# EasyEDA Pro project ProPrj_轮腿机器人-世博同学-正式版.epro, schematic 双轮腿-第一次量产版本
Board Name: 主板-ESP32; Create Date: 2024-08-16; Page Name: v3.0; Project Name: 轮腿机器人-世博同学-正式版; Schematic Name: 双轮腿-第一次量产版本; Update Date: 2024-11-18; Add into BOM: yes; Convert to PCB: yes; Date: 2022-08-08; Draw By: MUSHIBO; REV: 1.0; Sheet: 1/1
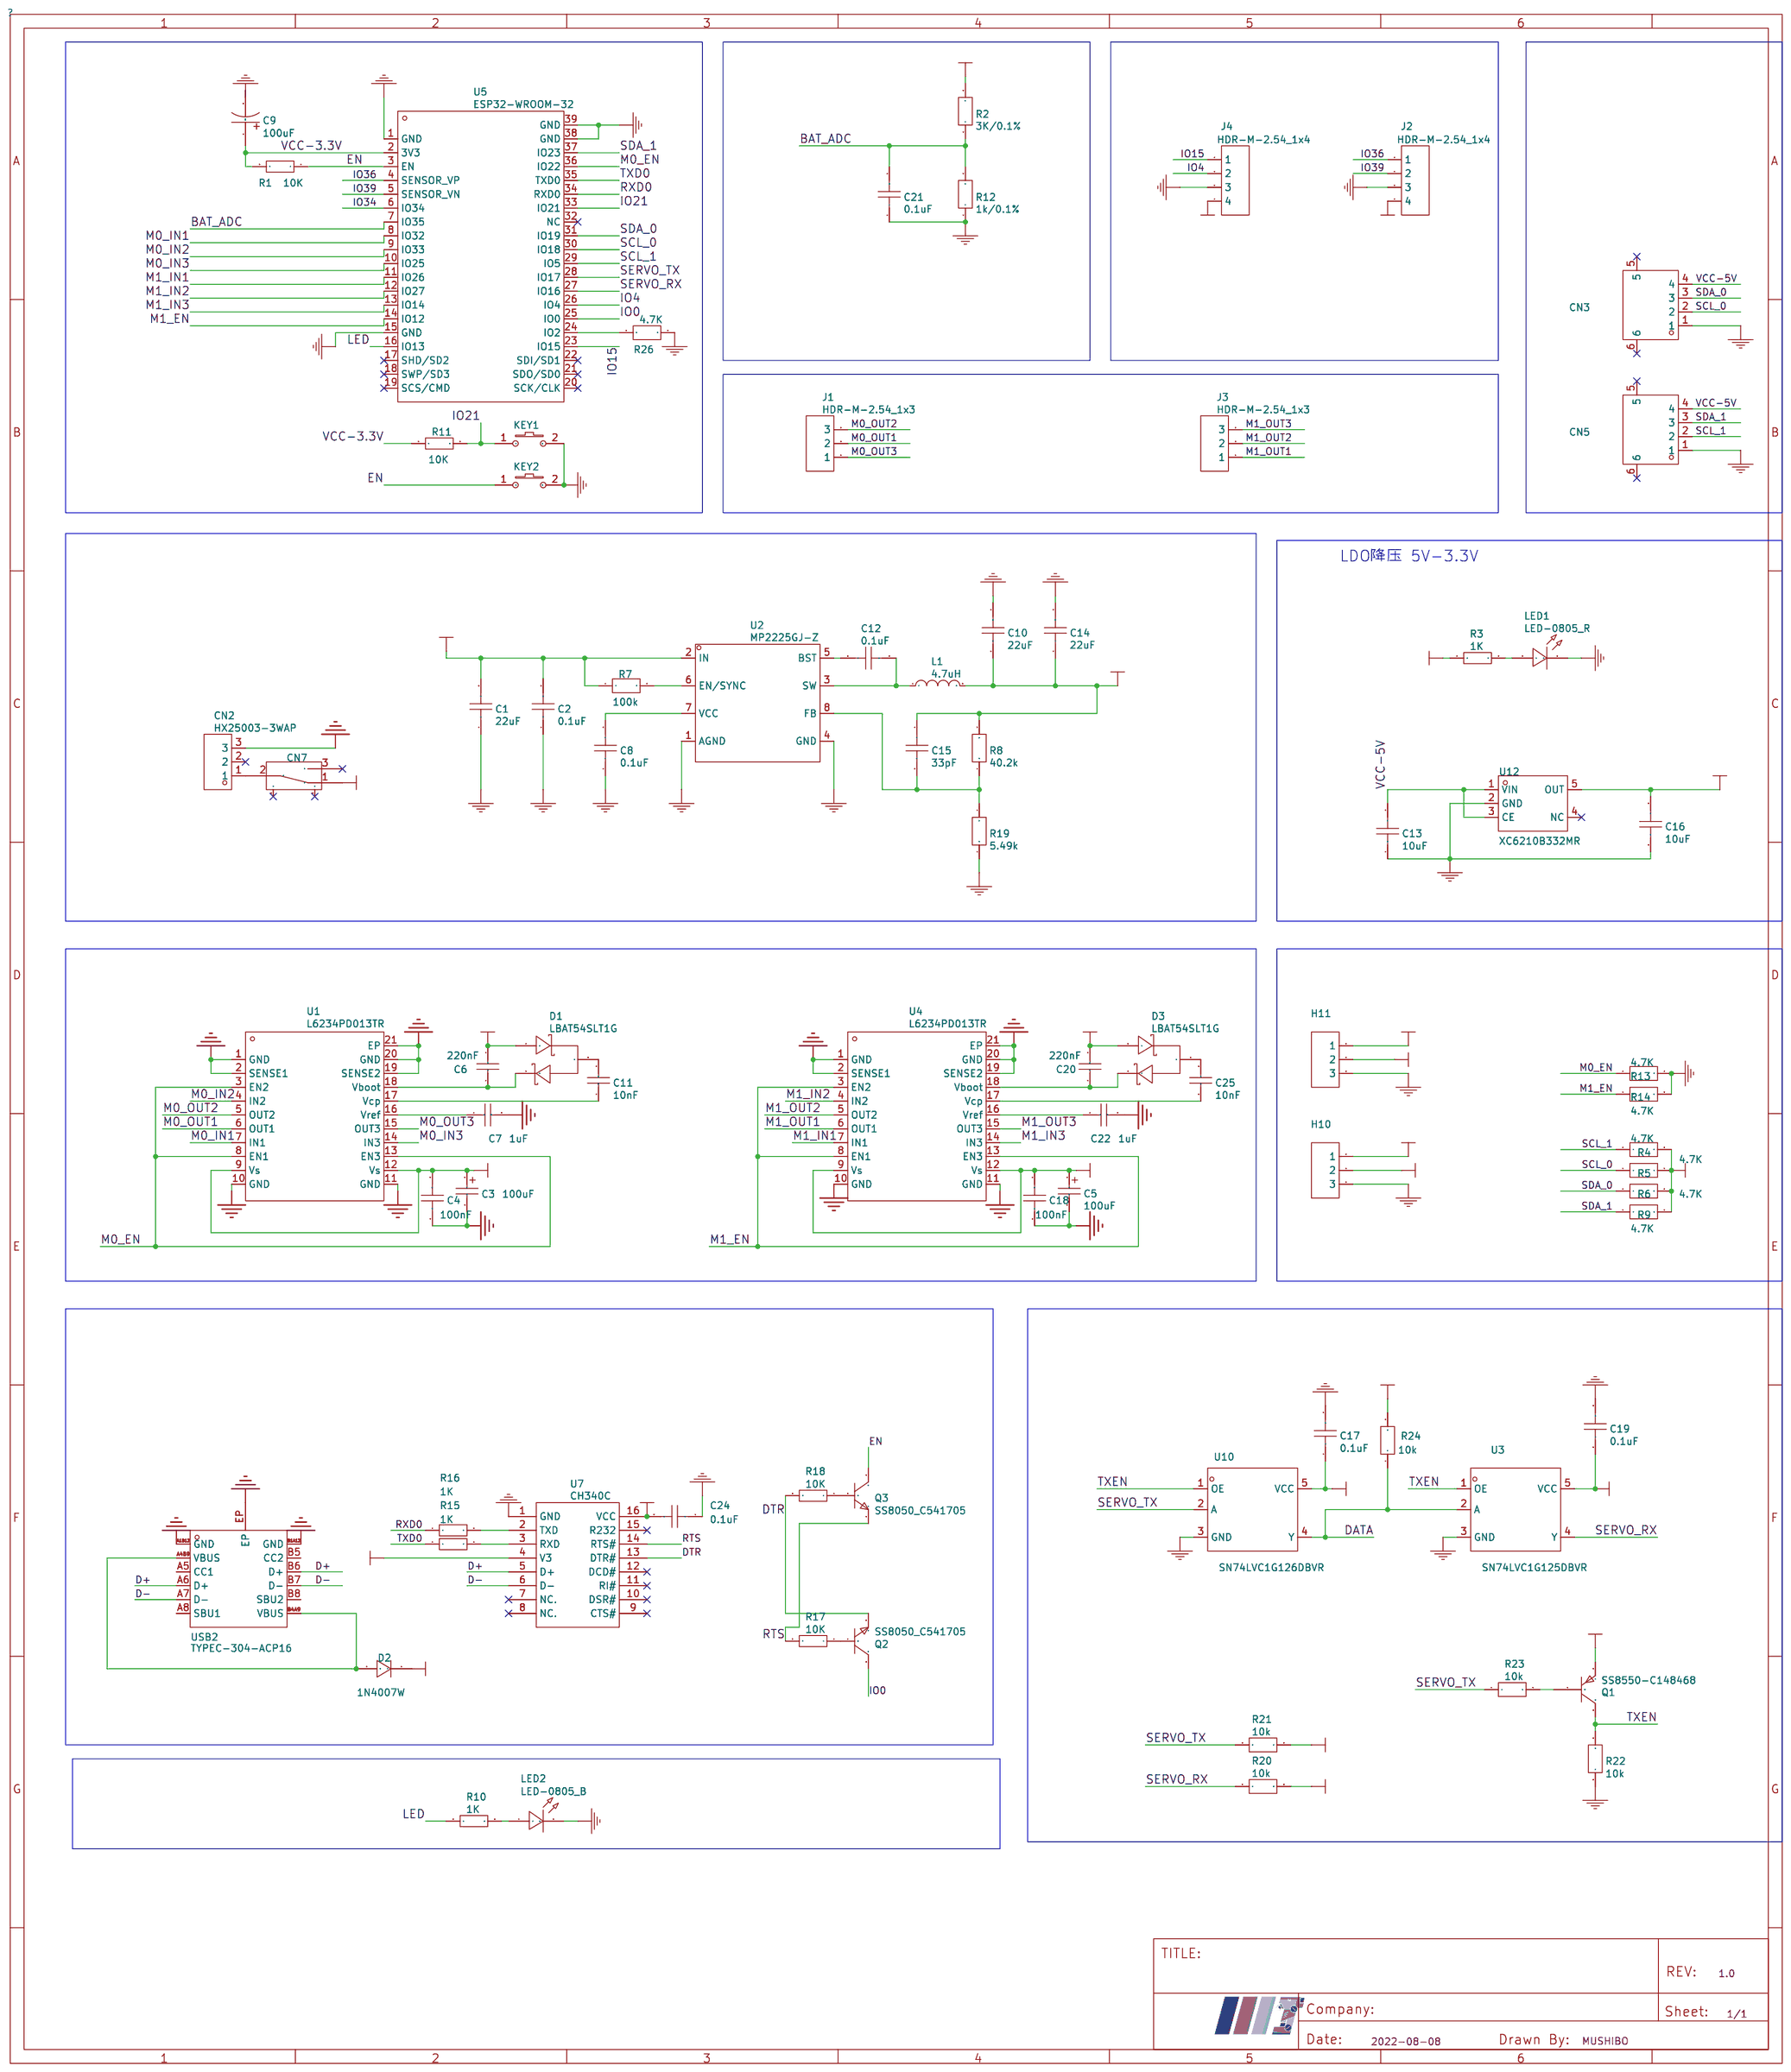
[diagram p0: schematic sheet]

## Parts
C1  22uF  [C0805]
C2  0.1uF  [C0805]
C3  100uF  [CAP-SMD_L7.3-W4.3-R-RD]
C4  100nF  [C0805]
C5  100uF  [CAP-SMD_L7.3-W4.3-R-RD]
C6  220nF  [C0805]
C7  1uF  [C0805]
C8  0.1uF  [C0805]
C9  100uF  [CAP-SMD_L3.5-W2.8-R-RD]
C10  22uF  [C0805]
C11  10nF  [C0805]
C12  0.1uF  [C0805]
C13  10uF  [C0805]
C14  22uF  [C0805]
C15  33pF  [C0805]
C16  10uF  [C0805]
C17  0.1uF  [C0805]
C18  100nF  [C0805]
C19  0.1uF  [C0805]
C20  220nF  [C0805]
C21  0.1uF  [C0805]
C22  1uF  [C0805]
C24  0.1uF  [C0805]
C25  10nF  [C0805]
CN2  HX25003-3WAP  [CONN-TH_3P-P2.50_HX25003-3WAP]
CN3  A1257WV-S-4P  [CONN-SMD_A1257WV-S-4P]
CN5  A1257WV-S-4P  [CONN-SMD_A1257WV-S-4P]
CN7  SS-12D02-VG4  [SW-TH_SS-12D02-VG4]
D1  LBAT54SLT1G  [SOT-23_L2.9-W1.3-P1.90-LS2.4-BR]
D2  1N4007W  [SOD-123_L2.8-W1.8-LS3.7-RD]
D3  LBAT54SLT1G  [SOT-23_L2.9-W1.3-P1.90-LS2.4-BR]
H10  5264-3A  [CONN-TH_5264-3AW]
H11  5264-3A  [CONN-TH_5264-3AW]
J1  HDR-M-2.54_1x3  [HDR-M-2.54_1X3]
J2  HDR-M-2.54_1x4  [HDR-M-2.54_1X4]
J3  HDR-M-2.54_1x3  [HDR-M-2.54_1X3]
J4  HDR-M-2.54_1x4  [HDR-M-2.54_1X4]
KEY1  K2-3.6×6.1_SMD  [KEY-SMD_2P-L6.2-W3.6-LS8.0]
KEY2  K2-3.6×6.1_SMD  [KEY-SMD_2P-L6.2-W3.6-LS8.0]
L1  4.7uH  [IND-SMD_L7.3-W6.6]
LED1  LED-0805_R  [LED0805_RED]
LED2  LED-0805_B  [LED0805_BLUE]
Q1  SS8550-C148468  [SOT-23-3_L2.9-W1.3-P1.90-LS2.4-BR]
Q2  SS8050_C541705  [SOT-23-3_L2.9-W1.3-P1.90-LS2.4-BR]
Q3  SS8050_C541705  [SOT-23-3_L2.9-W1.3-P1.90-LS2.4-BR]
R1  10K  [R0805]
R2  3K/0.1%  [R0805]
R3  1K  [R0805]
R4  4.7K  [R0603]
R5  4.7K  [R0603]
R6  4.7K  [R0603]
R7  100k  [R0805]
R8  40.2k  [R0805]
R9  4.7K  [R0603]
R10  1K  [R0805]
R11  10K  [R0805]
R12  1k/0.1%  [R0805]
R13  4.7K  [R0603]
R14  4.7K  [R0603]
R15  1K  [R0603]
R16  1K  [R0603]
R17  10K  [R0603]
R18  10K  [R0603]
R19  5.49k  [R0805]
R20  10k  [R0805]
R21  10k  [R0805]
R22  10k  [R0805]
R23  10k  [R0805]
R24  10k  [R0805]
R26  4.7K  [R0603]
U1  L6234PD013TR  [POWERSO20_L15.9-W11.0-P1.27-LS14.2-BL-EP]
U2  MP2225GJ-Z  [TSOT-23-8_L2.9-W1.6-P0.65-LS2.8-BR]
U3  SN74LVC1G125DBVR  [SOT-23-5_L3.0-W1.7-P0.95-LS2.8-BR]
U4  L6234PD013TR  [POWERSO20_L15.9-W11.0-P1.27-LS14.2-BL-EP]
U5  ESP32-WROOM-32  [WIFIM-SMD_ESP-32S]
U7  CH340C  [SOP-16_L10.0-W3.9-P1.27-LS6.0-BL]
U10  SN74LVC1G126DBVR  [SOT-23-5_L3.0-W1.7-P0.95-LS2.8-BR]
U12  XC6210B332MR  [SOT-23-5_L2.9-W1.6-P0.95-LS2.8-BR]
USB2  TYPEC-304-ACP16  [USB-C-SMD_TYPE-C-16P-1]

## Library data of the parts
C1 C10 C14 = 22uF: Supplier Part: C602037; Supplier: LCSC
C2 C8 C12 C24 = 0.1uF: Supplier Part: C1525; Manufacturer: LCSC
C3 C5 = TAJD107M020RNJ: Supplier: LCSC; Manufacturer: AVX; Supplier Part: C99373; JLCPCB Part Class: Extended Part
C4 C18 = C0805X104K101T: Supplier: LCSC; Supplier Part: C485772; Manufacturer: HEC(Holy Stone Enterprise); JLCPCB Part Class: Extended Part
C6 C20 = CL21B224KBFNNNE: Supplier: LCSC; Manufacturer: SAMSUNG; Supplier Part: C5378; JLCPCB Part Class: Basic
C7 C22 = CL21B105KBFNNNE: Supplier: LCSC; Manufacturer: SAMSUNG; Supplier Part: C28323; JLCPCB Part Class: Basic
C9 = CA45-B-6.3V-100uF-M: Supplier: LCSC; Supplier Part: C140373; Manufacturer: Shenzhen Zhenhua XinYun Elec; JLCPCB Part Class: Extended Part
C11 C25 = CL21A106KAYNNNE: Supplier: LCSC; Manufacturer: SAMSUNG; Supplier Part: C15850; JLCPCB Part Class: Basic
C13 C16 = CL21A106KOQNNNE: Supplier Part: C1713; Supplier: LCSC; Manufacturer: SAMSUNG
C15 = 33pF: Supplier Part: C157687; Supplier: LCSC
C17 C19 C21 = CC0805KRX7R9BB104: Supplier Part: C49678; Supplier: LCSC; Manufacturer: YAGEO
CN2 = HX25003-3WAP: Supplier: LCSC; Supplier Part: C442327; Manufacturer: HX(红星); JLCPCB Part Class: Extended Part
CN3 CN5 = A1257WV-S-4P: Supplier: LCSC; Supplier Part: C225120; Manufacturer: Changjiang Connectors; JLCPCB Part Class: Extended Part
CN7 = SS-12D02-VG4: Supplier: LCSC; Supplier Part: C136719; Manufacturer: Rectangular Connectors - Contacts
D1 D3 = LBAT54SLT1G: Supplier: LCSC; Manufacturer: LRC; image: //image.lceda.cn/szlcsc/C12765.jpg; Supplier Part: C12765; JLCPCB Part Class: Extend; JLCPCB SMD: Yes
D2 = 1N4007W: Supplier: LCSC; Supplier Part: C328592; Manufacturer: BLUE ROCKET
H10 H11 = 5264-3A: Supplier Part: C146690; Supplier: LCSC
J1 J3 = HDR-M-2.54_1x3: Supplier Part: C180248; Supplier: LCSC
J2 J4 = HDR-M-2.54_1x4: Supplier Part: C124378; Supplier: LCSC
KEY1 KEY2 = K2-1107ST-A4SW-06: Supplier Part: C118141; Supplier: LCSC; 制造商: 韩国韩荣
L1 = MCS0630-4R7MPY1: Supplier: LCSC; Supplier Part: C2937097; Manufacturer: PSA(信昌电陶)
LED1 = 17-21SURC/S530-A3/TR8: Manufacturer: EVERLIGHT(台湾亿光); Supplier Part: C72037
LED2 = D-B080508B1-KS2: Manufacturer: 方舟 ARKLED; Supplier Part: C108412
Q1 = SS8550: Supplier: LCSC; Manufacturer: Yenji; Supplier Part: C148468
Q2 Q3 = SS8050: Supplier: LCSC; Supplier Part: C541705; Manufacturer: AnBon
R1 R11 R15-R18 = RMCF0603JT10K0: Supplier: LCSC; Supplier Part: C238881; Manufacturer: Stackpole Elec
R2 = TC0525B3001T5E: Supplier Part: C97164; Supplier: LCSC; Manufacturer: UniOhm
R3 R10 = 0805W8F1001T5E: Supplier: LCSC; Manufacturer: UniOhm; Supplier Part: C17513; JLCPCB Part Class: Basic
R4-R6 R9 R13 R14 R26 = 4.7K
R7 = 100k
R8 = 40.2k
R12 = ARG05BTC1001: Supplier Part: C309081; Supplier: LCSC; Manufacturer: Viking Tech
R19 = 5.49k
R20 R21 R23 R24 = 0805W8F1002T5E: Supplier Part: C17414; Supplier: LCSC; Manufacturer: UniOhm
R22 = 0805W8F2002T5E: Supplier Part: C4328; Supplier: LCSC; Manufacturer: UniOhm
U1 U4 = L6234PD013TR: Supplier: LCSC; Manufacturer: STMicroelectronics; Supplier Part: C77581
U2 = MP2225GJ-Z: Supplier: LCSC; Manufacturer: MPS; Supplier Part: C133066; JLCPCB Part Class: Extended Part
U3 = SN74LVC1G125DBVR: Supplier: LCSC; Manufacturer: TI; image: //image.lceda.cn/szlcsc/C23654.jpg; Supplier Part: C23654; JLCPCB Part Class: Extend
U5 = ESP32-WROOM-32: Supplier: LCSC; Supplier Part: C82899; Manufacturer: Espressif Systems; JLCPCB Part Class: Extended Part
U7 = CH340C: Supplier: LCSC; Manufacturer: WCH(南京沁恒); Supplier Part: C84681; JLCPCB Part Class: Extended Part
U10 = SN74LVC1G126DBVR: Supplier: LCSC; Manufacturer: TI; image: //image.lceda.cn/szlcsc/C23654.jpg; Supplier Part: C7834; JLCPCB Part Class: Extend
U12 = XC6210B332MR: LCSC Part Name: Higt PSRR Voltage Regulator; Supplier Part: C3021084; Manufacturer: TECH PUBLIC(台舟); Supplier Footprint: SOT-23-5; JLCPCB Part Class: 扩展库; Datasheet: https://atta.szlcsc.com/upload/public/pdf/source/20220524/E0126CADD4FAB104D4B88A5F9575F61A.pdf; Supplier: LCSC
USB2 = TYPEC-304-ACP16: 连接器类型:Type-C;标准:-;公母:母;端口数量:1;触点数量:16P;安装方式:卧贴;额定电流 - 电源:3A;触头材质:铜;触头镀层:金;工作温度范围:-40℃~+85℃;焊接温度(最大值):-;; LCSC Part Name: Type-C 母 卧贴; Supplier Part: C2982555; Manufacturer: XUNPU(讯普); Supplier Footprint: SMD; JLCPCB Part Class: 扩展库; Datasheet: https://atta.szlcsc.com/upload/public/pdf/source/20220311/3C907F75E12F45E4EE7F73565AB9C294.pdf; Supplier: LCSC; Connector Type: Type-C; Gender: 母; Number of Ports: 1; Number of Contacts: 16P; Mounting Style: 卧贴; Current Rating - Power (Max): 3A; Contact Material: 铜; Contact Plating: 金; Operating Temperature Range: -40℃~+85℃

## Nets
GND: C1.1 C2.1 C3.2 C4.1 C5.2 C7.2 C8.1 C9.2 C10.1 C13.1 C14.2 C16.1 C17.2 C18.1 C19.2 C21.1 C22.2 C24.1 CN2.3 CN3.1 CN5.1 H10.3 H11.3 J2.3 J4.3 KEY1.2 KEY2.2 LED1.2 LED2.2 R12.1 R13.2 R14.2 R19.1 R22.1 R26.2 U1.1(GND) U1.2(SENSE1) U1.10(GND) U1.11(GND) U1.19(SENSE2) U1.20(GND) U1.21(EP) U2.1(AGND) U2.4(GND) U3.3(GND) U4.1(GND) U4.2(SENSE1) U4.10(GND) U4.11(GND) U4.19(SENSE2) U4.20(GND) U4.21(EP) U5.1(GND) U5.15(GND) U5.38(GND) U5.39(GND) U7.1(GND) U10.3(GND) U12.2(GND) USB2.A1B12(GND) USB2.B1A12(GND) USB2.EP
VCC-3.3V: C9.1 C16.2 C17.1 C19.1 C24.2 Q1.2(E) R1.2 R3.1 R4.2 R5.2 R6.2 R9.2 R11.2 R20.2 R21.1 R24.2 U3.5(VCC) U5.2(3V3) U7.4(V3) U7.16(VCC) U10.5(VCC) U12.5(OUT)
VCC-5V: C10.2 C13.2 C14.1 C15.1 CN3.4 CN5.4 D2.1 J2.4 J4.4 L1.2 R8.2 U12.1(VIN) U12.3(CE)
VIN: C1.2 C2.2 C3.1 C4.2 C5.1 C6.1 C18.2 C20.1 CN7.1 D1.1(A) D3.1(A) H10.2 H11.2 R2.2 R7.1 U1.9(Vs) U1.12(Vs) U2.2(IN) U4.9(Vs) U4.12(Vs)
BAT_ADC: C21.2 R2.1 R12.2 U5.7(IO35)
D+: U7.5(D+) USB2.A6(D+) USB2.B6(D+)
D-: U7.6(D-) USB2.A7(D-) USB2.B7(D-)
DATA: H10.1 H11.1 R24.1 U3.2(A) U10.4(Y)
DTR: Q2.2(E) R18.2 U7.13(DTR#)
EN: KEY2.1 Q3.3(C) R1.1 U5.3(EN)
IO0: Q2.3(C) U5.25(IO0)
IO4: J4.2 U5.26(IO4)
IO15: J4.1 U5.23(IO15)
IO21: KEY1.1 R11.1 U5.33(IO21)
IO34: U5.6(IO34)
IO36: J2.1 U5.4(SENSOR_VP)
IO39: J2.2 U5.5(SENSOR_VN)
LED: R10.1 U5.16(IO13)
M0_EN: R13.1 U1.3(EN2) U1.8(EN1) U1.13(EN3) U5.36(IO22)
M0_IN1: U1.7(IN1) U5.8(IO32)
M0_IN2: U1.4(IN2) U5.9(IO33)
M0_IN3: U1.14(IN3) U5.10(IO25)
M0_OUT1: J1.2 U1.6(OUT1)
M0_OUT2: J1.3 U1.5(OUT2)
M0_OUT3: J1.1 U1.15(OUT3)
M1_EN: R14.1 U4.3(EN2) U4.8(EN1) U4.13(EN3) U5.14(IO12)
M1_IN1: U4.7(IN1) U5.11(IO26)
M1_IN2: U4.4(IN2) U5.12(IO27)
M1_IN3: U4.14(IN3) U5.13(IO14)
M1_OUT1: J3.1 U4.6(OUT1)
M1_OUT2: J3.2 U4.5(OUT2)
M1_OUT3: J3.3 U4.15(OUT3)
RTS: Q3.2(E) R17.2 U7.14(RTS#)
RXD0: R16.1 U5.34(RXD0)
SCL_0: CN3.2 R5.1 U5.30(IO18)
SCL_1: CN5.2 R4.1 U5.29(IO5)
SDA_0: CN3.3 R6.1 U5.31(IO19)
SDA_1: CN5.3 R9.1 U5.37(IO23)
SERVO_RX: R20.1 U3.4(Y) U5.27(IO16)
SERVO_TX: R21.2 R23.1 U5.28(IO17) U10.2(A)
TXD0: R15.1 U5.35(TXD0)
TXEN: Q1.3(C) R22.2 U3.1(OE) U10.1(OE)
$1N79: C22.1 U4.16(Vref)
$1N80: C7.1 U1.16(Vref)
$1N145: C6.2 D1.2(K) U1.18(Vboot)
$1N146: C11.1 U1.17(Vcp)
$1N187: C20.2 D3.2(K) U4.18(Vboot)
$1N188: C25.1 U4.17(Vcp)
$1N369: R26.1 U5.24(IO2)
$1N417: LED1.1 R3.2
$1N643: R7.2 U2.6(EN/SYNC)
$1N654: C8.2 U2.7(VCC)
$1N667: C12.1 L1.1 U2.3(SW)
$1N694: C12.2 U2.5(BST)
$1N701: C15.2 R8.1 R19.2 U2.8(FB)
$1N796: Q1.1(B) R23.2
$1N976: LED2.1 R10.2
$1N1274: R15.2 U7.3(RXD)
$1N1275: R16.2 U7.2(TXD)
$1N1361: C11.2 D1.3(AK)
$1N1362: C25.2 D3.3(AK)
$1N1373: CN2.1 CN7.2
$1N1380: Q2.1(B) R17.1
$1N1381: Q3.1(B) R18.1
$1N13794: D2.2 USB2.A4B9(VBUS) USB2.B4A9(VBUS)

Not connected (* = marked no-connect by the designer): CN2 2*; CN3 5* 6*; CN5 5* 6*; CN7 3* 4* 5*; U5 17(SHD/SD2)* 18(SWP/SD3)* 19(SCS/CMD)* 20(SCK/CLK)* 21(SDO/SD0)* 22(SDI/SD1)* 32(NC)*; U7 7(NC.)* 8(NC.)* 9(CTS#)* 10(DSR#)* 11(RI#)* 12(DCD#)* 15(R232)*; U12 4(NC)*; USB2 A5(CC1) A8(SBU1) B5(CC2) B8(SBU2)

## Notes on the sheet
- LDO降压 5V-3.3V
